# EasyEDA Pro project ProPrj_CSDR_2026-11-13.epro, board PCB1
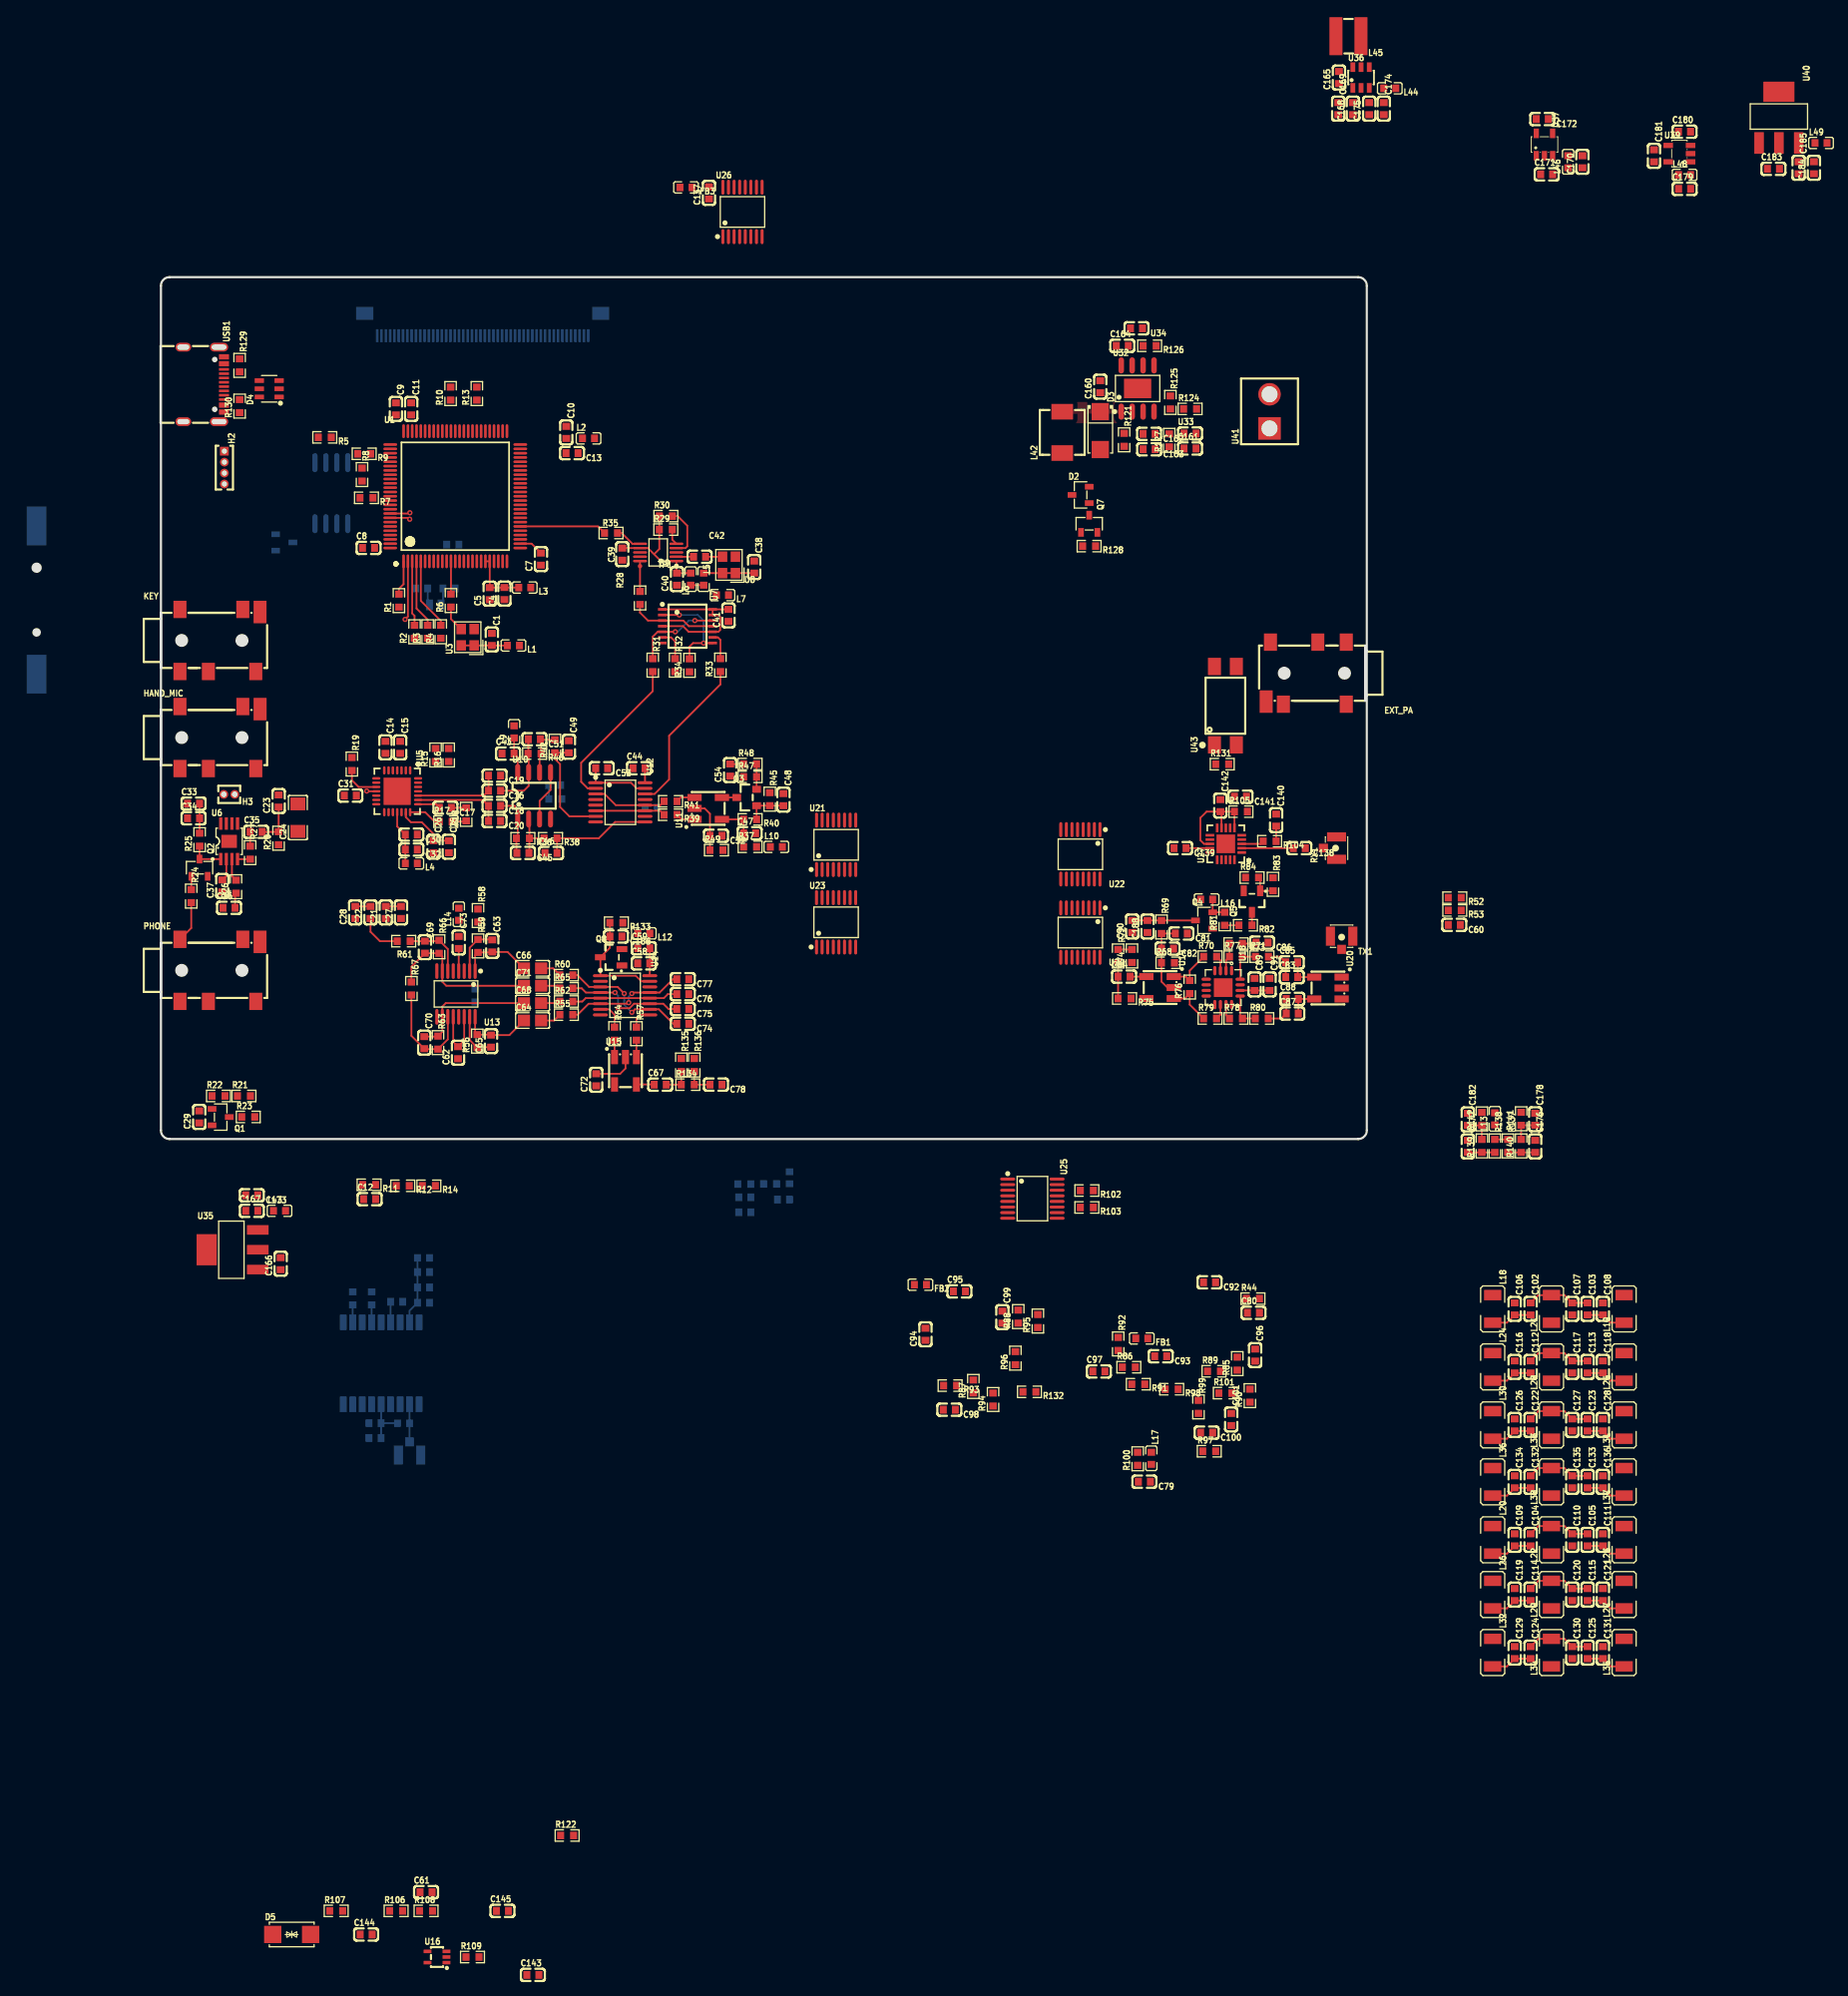
[diagram p16: board, top side]
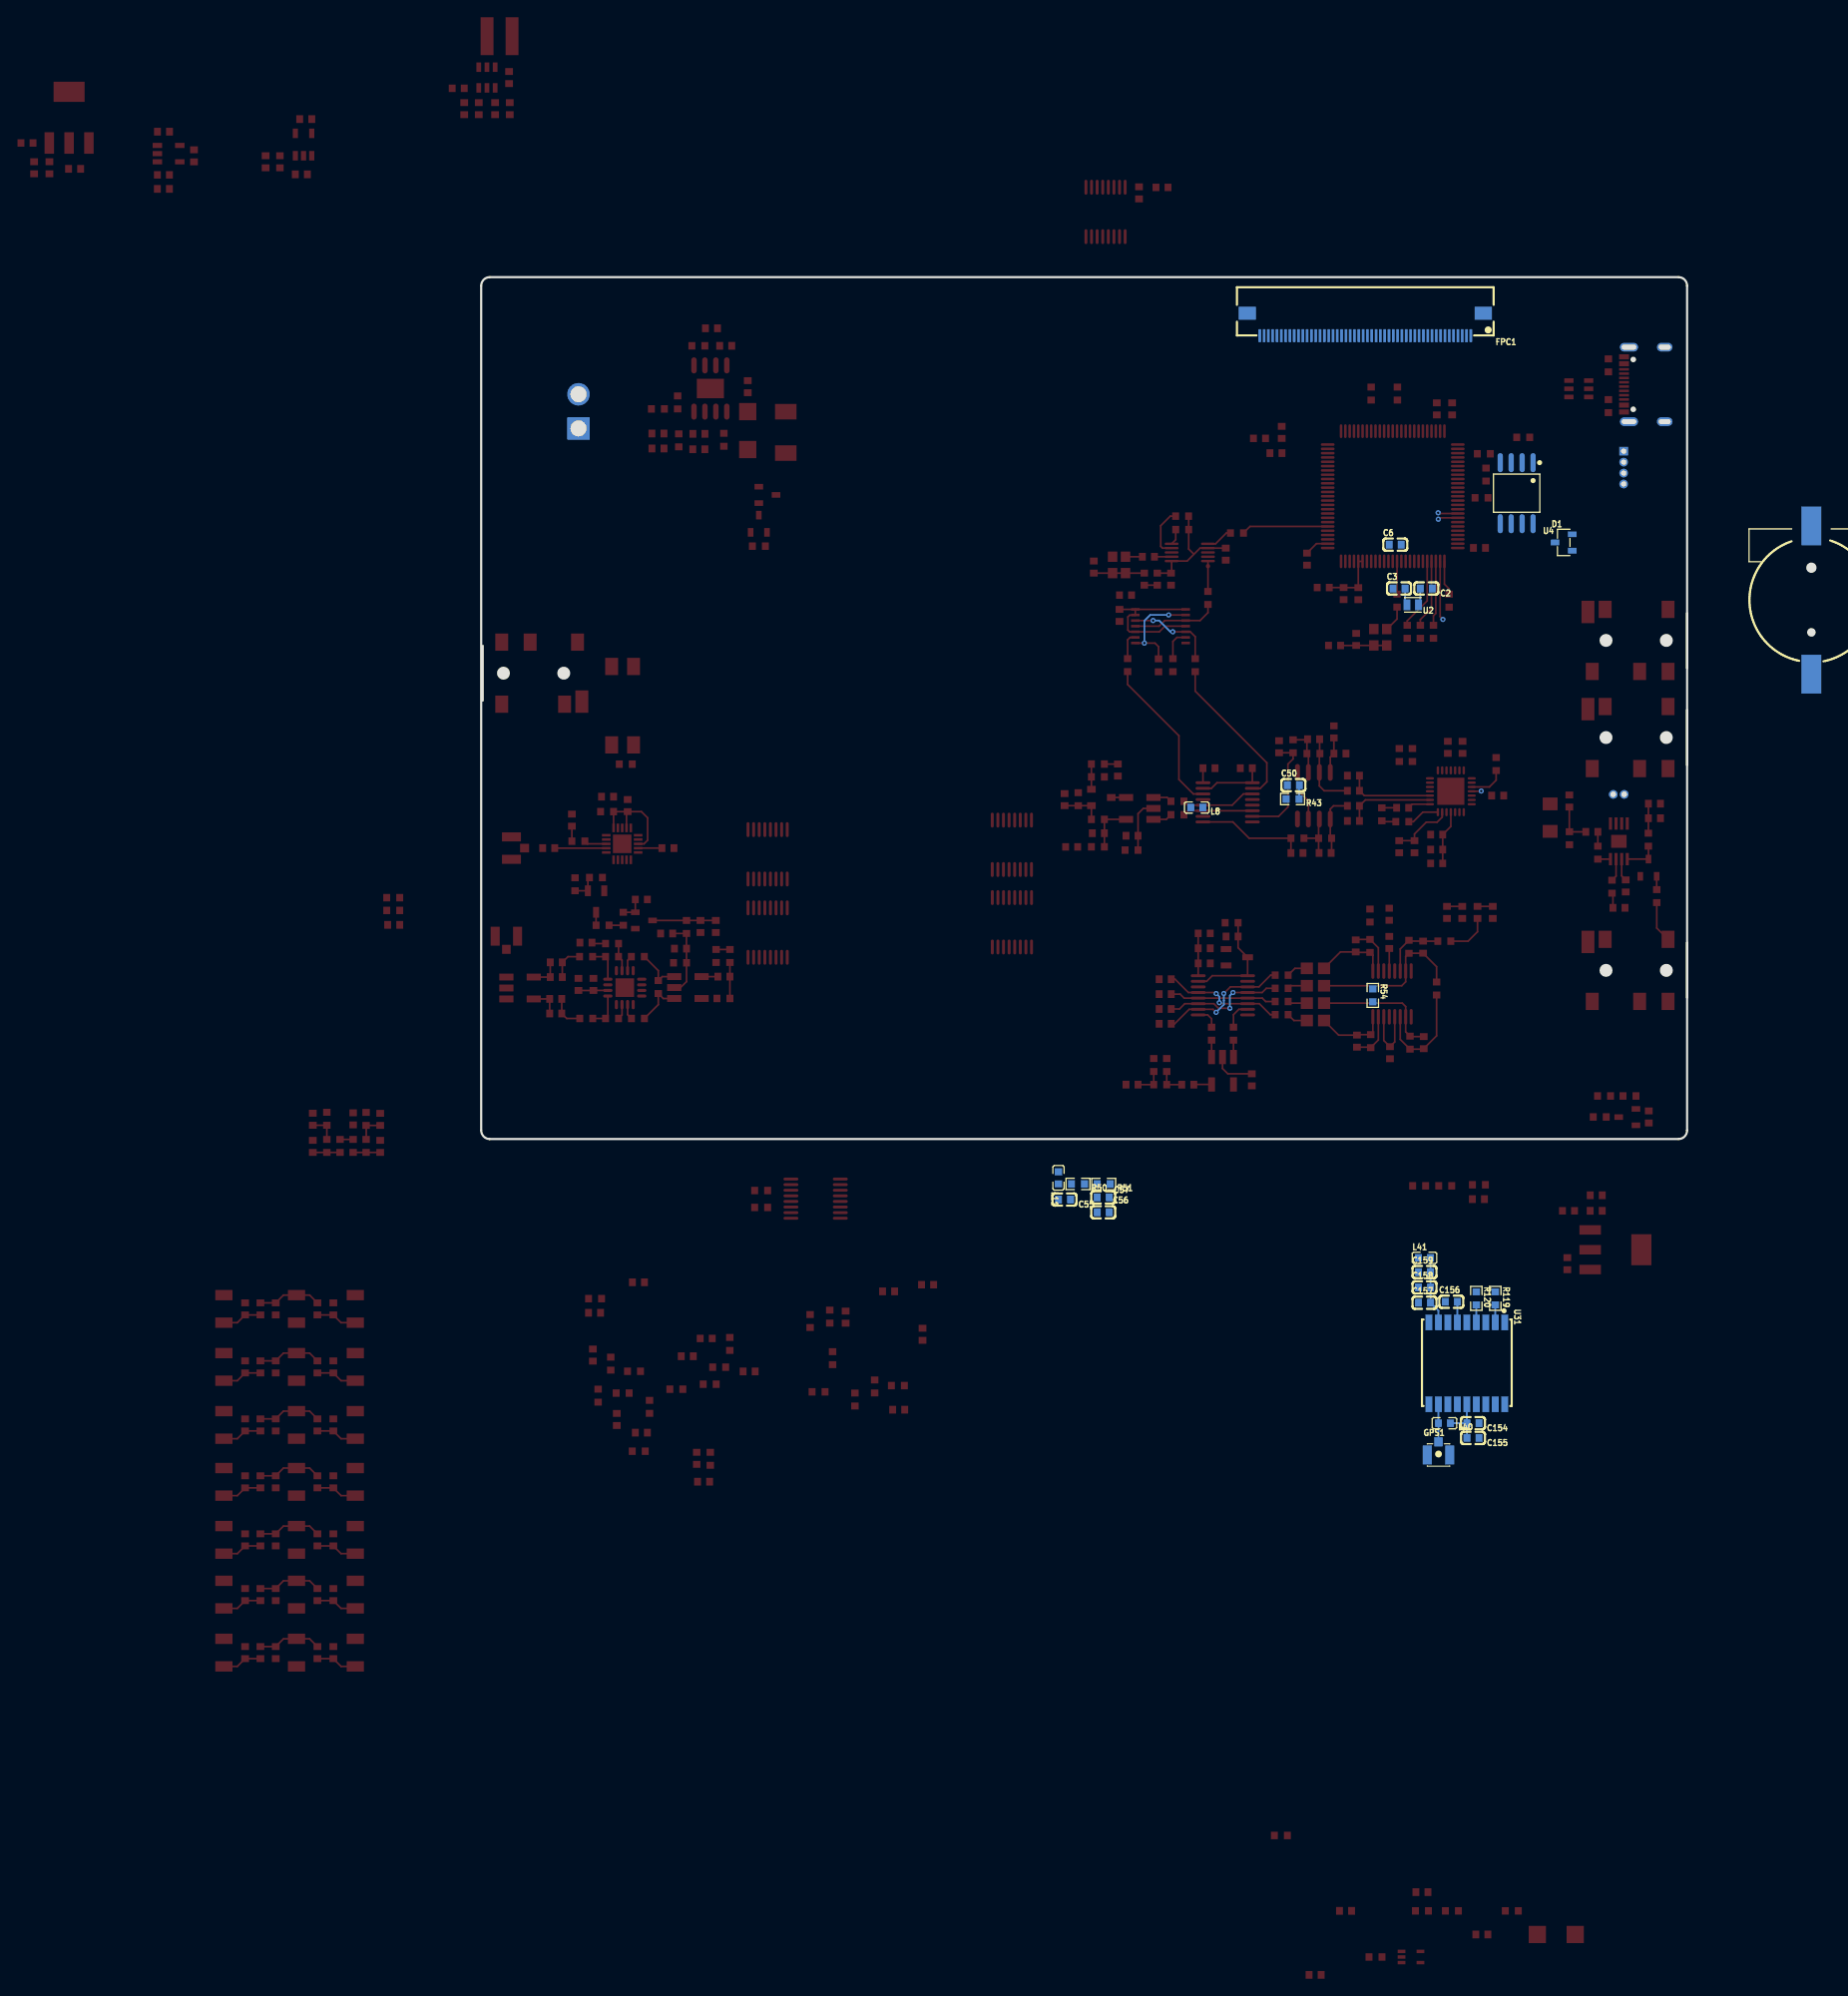
[diagram p17: board, bottom side, seen from below]

Outline 155.03 x 100 mm; copper layers: Top Layer, Inner1, Inner2, Bottom Layer. Coordinates in mm from the lower left corner of the outline.
Outline path: 15.03,99 15.03,1 arc(15.32,0.29) 16.03,0 154.03,0 arc(154.73,0.29) 155.03,1 155.03,99 arc(154.73,99.71) 154.03,100 16.03,100 arc(15.32,99.71) 15.03,99
Stack: Top Layer 0.035mm Outer layer thickness 1oz / Dielectric1 0.4133mm 7628 RC49% 8.6mil / Inner1 0.035mm Inner layer thickness / Dielectric2 0.4133mm 1.1mm H/HOZ Copper / Inner2 0.035mm Inner layer thickness / Dielectric3 0.4133mm 7628 RC49% 8.6mil / Bottom Layer 0.035mm Outer layer thickness 1oz

## Design rules (mm)
net USB_P: DP1
net USB_N: DP1
spacing copperThickness1oz (default): track to track 0.127, other pairs 0.127 to 0.5
spacing copperThickness2oz: track to track 0.2, other pairs 0.127 to 0.5
spacing copperThicknessInner0.5oz: track to track 0.127, other pairs 0.127 to 0.5
spacing Analog_Sense: track to track 0.3, other pairs 0.127 to 0.5
spacing Power: track to track 0.6, other pairs 0.127 to 0.6
spacing Power_HC: track to track 0.6, other pairs 0.127 to 0.6
spacing RF_50ohm: track to track 0.5, other pairs 0.127 to 0.5
spacing USB_90ohm: track to track 0.45, other pairs 0.127 to 0.5
spacing LO_CLK: track to track 0.3, other pairs 0.127 to 0.5
track width copperThickness1oz (default): min 0.1, default 0.2, max 5
track width copperThickness2oz: min 0.203, default 0.254, max 2.54
track width copperThickness0.5oz: min 0.1, default 0.2, max 5
track width Analog_Sense: min 0.2, default 0.3, max 5
track width Power: min 0.3, default 0.35, max 5
track width Power_HC: min 0.8, default 2, max 5
track width RF_50ohm: min 0.2, default 0.38, max 5
track width USB_90ohm: min 0.3, default 0.3, max 5
track width VBUS: min 0.3, default 0.5, max 5
track width LO_CLK: min 0.15, default 0.2, max 0.5
differential pair differentialPair (default): width min 0.25, default 0.3, max 0.4; gap min 0.15, default 0.15
net GND uses copperRegion1
net MCU_VDD uses Power, copperRegion_Power
net RX_ANT uses RF_50ohm, copperRegion_RF_50ohm
net VIN uses Power, copperRegion_Power
net $14N11 uses copperRegion1
net 8V uses Power, copperRegion_Power
net 5VA uses Power, copperRegion_Power
net 3V3_LO uses Power, copperRegion_Power
net 3V3_CODEC uses Power, copperRegion_Power
net USB_P uses USB_90ohm, copperRegion_USB_90ohm
net USB_N uses USB_90ohm, copperRegion_USB_90ohm
net OUT_TX uses RF_50ohm, copperRegion_RF_50ohm
net R_CLK_S0 uses LO_CLK, copperRegion_LO_CLK
net T_CLK_S0 uses LO_CLK, copperRegion_LO_CLK
net T_CLK_S1 uses LO_CLK, copperRegion_LO_CLK
net R_CLK_S1 uses LO_CLK, copperRegion_LO_CLK

## Placement (name value [footprint] x y rotation side)
BT1  CR1220-A1  [BAT-SMD_CR1220-2]  0.59 62.54 270 bottom
C1  100nF  [C0603]  53.45 57.97 270 top
C2  15pF  [C0603]  45.3 63.88 0 bottom
C3  15pF  [C0603]  48.47 63.88 180 bottom
C4  100nF  [C0603]  54.9 63.29 90 top
C5  1uF  [C0603]  53.2 63.28 90 top
C6  100nF  [C0603]  48.91 68.97 180 bottom
C7  100nF  [C0603]  59.15 67.28 90 top
C8  100nF  [C0603]  39.13 68.58 0 top
C9  100nF  [C0603]  42.31 84.71 270 top
C10  10uF  [C0603]  62.09 81.99 270 top
C11  2.2uF  [C0603]  44.08 84.71 270 top
C12  100nF  [C0603]  39.25 -6.98 0 top
C13  2.2uF  [C0603]  62.76 79.58 180 top
C14  10uF  [C0603]  41.09 45.44 270 top
C15  100nF  [C0603]  42.8 45.44 270 top
C16  1uF  [C0603]  53.76 40.41 180 top
C17  1uF  [C0603]  48.05 38.43 180 top
C18  1uF  [C0603]  53.76 38.66 180 top
C19  1nF  [C0603]  53.76 42.16 180 top
C20  1nF  [C0603]  53.76 36.91 180 top
C21  1uF  [C0603]  41.13 26.29 90 top
C22  1uF  [C0603]  39.36 26.29 90 top
C23  1uF  [C0603]  28.7 39.22 90 top
C24  220uF  [C1206]  30.93 37.29 90 top
C25  100nF  [C0603]  48.45 33.92 270 top
C26  10uF  [C0603]  46.67 33.92 270 top
C27  1nF  [C0603]  42.9 26.29 90 top
C28  1nF  [C0603]  37.58 26.29 90 top
C29  1uF  [C0603]  19.47 2.56 90 top
C30  10uF  [C0603]  44.1 35.32 180 top
C31  100nF  [C0603]  37.01 39.85 0 top
C32  100nF  [C0603]  44.1 33.58 180 top
C33  100nF  [C0603]  18.82 38.91 0 top
C34  10uF  [C0603]  18.82 37.22 0 top
C35  1uF  [C0603]  26.08 35.64 0 top
C36  1uF  [C0603]  22.93 26.83 0 top
C37  1uF  [C0603]  22.15 29.36 90 top
C38  100nF  [C0603]  83.9 66.36 270 top
C39  100nF  [C0603]  68.59 67.86 90 top
C40  100nF  [C0603]  74.94 64.96 90 top
C41  100nF  [C0603]  80.92 60.75 90 top
C42  10nF  [C0603]  77.56 67.56 180 top
C43  100nF  [C0603]  55.33 44.72 0 top
C44  100nF  [C0603]  70.53 43.02 0 top
C45  390pF  [C0603]  57.05 33.19 180 top
C46  10nF  [C0603]  60.32 33.19 0 top
C47  100nF  [C0603]  83.37 35.48 0 top
C48  100nF  [C0603]  87.3 39.38 270 top
C49  10nF  [C0603]  62.39 45.52 270 top
C50  100nF  [C0603]  60.73 41.06 180 bottom
C51  390pF  [C0603]  58.39 46.39 180 top
C52  100nF  [C0603]  79.47 35.19 180 top
C53  100nF  [C0603]  66.2 43.02 180 top
C54  100nF  [C0603]  81.11 42.81 90 top
C55  100nF  [C0603]  87.31 -7.02 0 bottom
C56  100nF  [C0603]  82.81 -6.77 0 bottom
C57  10uF  [C0603]  82.81 -8.5 0 bottom
C58  100nF  [C0603]  71.08 20.38 0 top
C59  100nF  [C0603]  71.08 22.13 0 top
C60  100nF  [C0603]  165.18 24.85 180 top
C61  1nF  [C0603]  45.81 -87.38 0 top
C62  1uF  [C0603]  49.52 10.01 90 top
C63  100pF  [C0603]  53.49 22.4 270 top
C64  22uF/0R  [C0805]  58.17 13.75 0 top
C65  100pF  [C0603]  53.35 11.36 90 top
C66  22uF/0R  [C0805]  58.17 19.8 0 top
C67  100nF  [C0603]  72.99 6.31 0 top
C68  22uF/0R  [C0805]  58.17 15.77 0 top
C69  100pF  [C0603]  45.67 22.26 270 top
C70  100pF  [C0603]  45.6 11.18 270 top
C71  22uF/0R  [C0805]  58.17 17.78 0 top
C72  100nF  [C0603]  65.56 6.87 90 top
C73  100nF  [C0603]  49.6 22.81 270 top
C74  22nF  [C0603]  75.61 13.37 180 top
C75  22nF  [C0603]  75.61 15.09 180 top
C76  22nF  [C0603]  75.61 16.81 180 top
C77  22nF  [C0603]  75.61 18.54 180 top
C78  100nF  [C0603]  79.47 6.31 180 top
C79  100nF  [C0603]  129.21 -39.76 180 top
C80  100nF  [C0603]  141.86 -20.16 0 top
C81  100nF  [C0603]  133.49 23.85 180 top
C82  470pF  [C0603]  131.89 22.09 180 top
C83  1uF  [C0603]  146.31 18.79 0 top
C84  100nF  [C0603]  126.85 18.84 0 top
C85  680pF  [C0603]  146.31 20.5 0 top
C86  100nF  [C0603]  142.86 22.79 180 top
C87  680pF  [C0603]  146.37 14.56 0 top
C88  1uF  [C0603]  146.37 16.26 0 top
C89  100nF  [C0603]  142 17.94 270 top
C90  470pF  [C0603]  127.79 24.66 90 top
C91  1uF  [C0603]  143.74 17.94 270 top
C92  100nF  [C0603]  136.77 -16.62 180 top
C93  100nF  [C0603]  131.1 -25.2 180 top
C94  100nF  [C0603]  103.78 -22.66 90 top
C95  100nF  [C0603]  107.73 -17.68 0 top
C96  100nF  [C0603]  142.06 -25.07 270 top
C97  100nF  [C0603]  123.92 -26.97 0 top
C98  100nF  [C0603]  106.56 -31.41 180 top
C99  100nF  [C0603]  112.72 -20.67 270 top
C100  100nF  [C0603]  136.43 -34.07 180 top
C101  1uF  [C0603]  139.28 -32.54 270 top
C102  390pF  [C0603]  174.04 -19.71 270 top
C103  390pF  [C0603]  180.65 -19.71 270 top
C104  390pF  [C0603]  174.04 -46.51 270 top
C105  390pF  [C0603]  180.65 -46.51 270 top
C106  390pF  [C0603]  172.19 -19.71 270 top
C107  390pF  [C0603]  178.88 -19.71 270 top
C108  390pF  [C0603]  182.43 -19.71 270 top
C109  390pF  [C0603]  172.19 -46.51 270 top
C110  390pF  [C0603]  178.88 -46.51 270 top
C111  390pF  [C0603]  182.43 -46.51 270 top
C112  390pF  [C0603]  174.04 -26.44 270 top
C113  390pF  [C0603]  180.65 -26.44 270 top
C114  390pF  [C0603]  174.04 -52.86 270 top
C115  390pF  [C0603]  180.65 -52.86 270 top
C116  390pF  [C0603]  172.19 -26.44 270 top
C117  390pF  [C0603]  178.88 -26.44 270 top
C118  390pF  [C0603]  182.43 -26.44 270 top
C119  390pF  [C0603]  172.19 -52.86 270 top
C120  390pF  [C0603]  178.88 -52.86 270 top
C121  390pF  [C0603]  182.43 -52.86 270 top
C122  390pF  [C0603]  174.04 -33.17 270 top
C123  390pF  [C0603]  180.65 -33.17 270 top
C124  390pF  [C0603]  174.04 -59.59 270 top
C125  390pF  [C0603]  180.65 -59.59 270 top
C126  390pF  [C0603]  172.19 -33.17 270 top
C127  390pF  [C0603]  178.88 -33.17 270 top
C128  390pF  [C0603]  182.43 -33.17 270 top
C129  390pF  [C0603]  172.19 -59.59 270 top
C130  390pF  [C0603]  178.88 -59.59 270 top
C131  390pF  [C0603]  182.43 -59.59 270 top
C132  390pF  [C0603]  174.04 -39.78 270 top
C133  390pF  [C0603]  180.65 -39.78 270 top
C134  390pF  [C0603]  172.19 -39.78 270 top
C135  390pF  [C0603]  178.88 -39.78 270 top
C136  390pF  [C0603]  182.43 -39.78 270 top
C137  100nF  [C0603]  78.65 109.78 90 top
C138  100nF  [C0603]  147.19 33.75 180 top
C139  100nF  [C0603]  133.34 33.75 180 top
C140  100pF  [C0603]  144.5 37 270 top
C141  100nF  [C0603]  140.36 39.72 180 top
C142  10uF  [C0603]  138.02 38.69 270 top
C143  10nF  [C0603]  58.21 -96.98 0 top
C144  4.7nF  [C0603]  38.85 -92.3 0 top
C145  100nF  [C0603]  54.68 -89.56 0 top
C154  10nF  [C0603]  39.88 -32.97 0 bottom
C155  47pF  [C0603]  39.88 -34.69 0 bottom
C156  100nF  [C0603]  42.4 -18.88 180 bottom
C157  820pF  [C0603]  45.51 -19 180 bottom
C158  100nF  [C0603]  45.51 -17.22 180 bottom
C159  10uF  [C0603]  45.51 -15.44 180 bottom
C160  100nF  [C0603]  124.08 87.29 90 top
C161  100nF  [C0603]  134.5 80.12 0 top
C162  5.6nF  [C0603]  129.75 81.82 180 top
C163  100nF  [C0603]  129.76 80.03 180 top
C164  100nF  [C0603]  126.64 92.03 0 top
C165  100nF  [C0603]  151.79 123.16 90 top
C166  47uF  [C0603]  28.93 -14.46 90 top
C167  100nF  [C0603]  25.58 -8.33 0 top
C168  100nF  [C0603]  153.41 119.55 90 top
C169  22uF  [C0603]  151.71 119.55 270 top
C170  22uF  [C0603]  180.05 113.39 90 top
C171  1uF  [C0603]  175.9 111.93 0 top
C172  1uF  [C0603]  175.39 118.34 180 top
C173  10uF  [C0603]  25.57 -6.53 180 top
C174  22uF  [C0603]  156.99 119.55 270 top
C175  100nF  [C0603]  155.31 119.55 90 top
C176  1uF  [C0603]  174.57 -0.85 270 top
C177  1uF  [C0603]  166.75 -0.85 270 top
C178  1uF  [C0603]  174.57 2.3 270 top
C179  22uF  [C0603]  191.92 110.24 0 top
C180  1uF  [C0603]  191.91 116.88 0 top
C181  1uF  [C0603]  188.37 114.08 270 top
C182  1uF  [C0603]  166.75 2.28 270 top
C183  47uF  [C0603]  202.23 112.57 0 top
C184  100nF  [C0603]  206.93 112.69 90 top
C185  10uF  [C0603]  205.15 112.69 270 top
C186  100nF  [C0603]  67.85 23.5 180 top
C188  10uF  [C0603]  129.57 24.66 90 top
D1  BAT54C  [SOT-23-3_L2.9-W1.3-P1.90-LS2.4-BR]  29.35 69.22 180 bottom
D2  BAT54C  [SOT-23-3_L2.9-W1.3-P1.90-LS2.4-BR]  121.79 74.73 0 top
D3  SS34  [SMA_L4.3-W2.6-LS5.1-RD]  124.08 82.2 270 top
D4  USBLC6-2SC6  [SOT-23-6_L2.9-W1.6-P0.95-LS2.8-BL]  27.6 87.05 90 top
D5  SMAJ15CA  [SMA_L4.3-W2.6-LS5.1-BI]  30.21 -92.3 0 top
EXT_PA  PJ-342  [AUDIO-SMD_PJ-342_C668606]  147.99 54.05 180 top
FB1  CBM160808U471T  [L0603]  128.9 -23.14 180 top
FB2  CBM160808U471T  [L0603]  103.2 -16.91 180 top
FB3  CBM160808U471T  [L0603]  75.99 110.41 180 top
FPC1  FPC0521-50PH20  [FPC-SMD_FPC0521-50PH20]  52.39 94.51 0 bottom
GPS1  6GHz  [IPEX-SMD_3P-L2.6-W2.6-LS3.0_RF1200001R]  43.89 -35.9 180 bottom
H2  PZ127V-11-04-0720  [HDR-TH_4P-P1.27-V-M]  22.39 77.9 270 top
H3  ZX-PZ1.27-1-2PZZ  [HDR-TH_2P-P1.27-V-M-2]  22.96 39.99 180 top
HAND_MIC  PJ-342  [AUDIO-SMD_PJ-342_C668606]  21.89 46.58 0 top
KEY  PJ-342  [AUDIO-SMD_PJ-342_C668606]  21.89 57.85 0 top
L1  MGGB1608M501HT-LF  [L0603]  55.95 57.26 180 top
L2  MGGB1608M501HT-LF  [L0603]  64.67 81.29 0 top
L3  MGGB1608M501HT-LF  [L0603]  57.27 63.99 180 top
L4  PBY160808T-601Y-N  [L0603]  44.1 31.98 180 top
L5  PBY160808T-601Y-N  [L0603]  78.04 64.96 270 top
L6  PBY160808T-601Y-N  [L0603]  76.54 64.96 270 top
L7  PBY160808T-601Y-N  [L0603]  80.22 63.11 180 top
L8  MGGB1608M501HT-LF  [L0603]  71.95 38.46 0 bottom
L9  MGGB1608M501HT-LF  [L0603]  56.03 47.24 90 top
L10  MGGB1608M501HT-LF  [L0603]  86.47 33.89 0 top
L11  MGGB1608M501HT-LF  [L0603]  88 -4.5 90 bottom
L12  PBY160808T-501Y-N  [L0603]  71.08 23.86 180 top
L13  PBY160808T-501Y-N  [L0603]  169.89 2.34 90 top
L14  PBY160808T-501Y-N  [L0603]  49.61 26.08 90 top
L16  MGGB1608M501HT-LF  [L0603]  136.43 27.8 180 top
L17  MGGB1608M501HT-LF  [L0603]  130.01 -37.05 270 top
L18  12nH  [L1210]  169.64 -19.71 270 top
L19  12nH  [L1210]  184.9 -19.71 90 top
L20  12nH  [L1210]  169.64 -46.51 270 top
L21  12nH  [L1210]  176.46 -19.71 90 top
L22  12nH  [L1210]  176.46 -46.51 90 top
L23  12nH  [L1210]  184.9 -46.51 90 top
L24  12nH  [L1210]  169.64 -26.44 270 top
L25  12nH  [L1210]  184.9 -26.44 90 top
L26  12nH  [L1210]  169.64 -52.86 270 top
L27  12nH  [L1210]  184.9 -52.86 90 top
L28  12nH  [L1210]  176.46 -26.44 90 top
L29  12nH  [L1210]  176.46 -52.86 90 top
L30  12nH  [L1210]  169.64 -33.17 270 top
L31  12nH  [L1210]  184.9 -33.17 90 top
L32  12nH  [L1210]  169.64 -59.59 270 top
L33  12nH  [L1210]  176.46 -33.17 90 top
L34  12nH  [L1210]  176.46 -59.59 90 top
L35  12nH  [L1210]  184.9 -59.59 90 top
L36  12nH  [L1210]  169.64 -39.78 270 top
L37  12nH  [L1210]  184.9 -39.78 90 top
L38  12nH  [L1210]  176.46 -39.78 90 top
L40  27nH  [L0603]  43.2 -32.97 0 bottom
L41  MGGB1608M501HT-LF  [L0603]  45.51 -13.79 180 bottom
L42  4.7uH  [IND-SMD_L5.2-W5.2_YSPI0530]  119.67 81.99 90 top
L43  MGGB1608M501HT-LF  [L0603]  28.79 -8.33 0 top
L44  MGGB1608M501HT-LF  [L0603]  157.69 121.91 180 top
L45  10uH  [IND-SMD_L4.0-W4.0_SNR4030]  152.89 127.96 180 top
L46  MGGB1608M501HT-LF  [L0603]  178.39 113.39 90 top
L48  MGGB1608M501HT-LF  [L0603]  191.92 111.87 0 top
L49  MGGB1608M501HT-LF  [L0603]  207.76 115.57 0 top
PHONE  PJ-342  [AUDIO-SMD_PJ-342_C668606]  21.89 19.57 0 top
Q1  MMBT3904  [SOT-23-3_L2.9-W1.3-P1.90-LS2.4-BR]  21.96 2.54 180 top
Q2  S8050  [SOT-23-3_L2.9-W1.3-P1.90-LS2.4-BR]  19.51 31.48 270 top
Q3  BFR92PE6327  [SOT-23_L2.9-W1.3-P1.90-LS2.4-BR]  83.03 39.63 0 top
Q4  IRLML6402  [SOT-23-3_L2.9-W1.3-P1.90-LS2.4-BR]  136.13 25.36 0 top
Q5  2N7002  [SOT-23-3_L2.9-W1.5-P1.90-LS2.6-BR]  141.69 27.55 90 top
Q7  BSS123  [SOT-23-3_L2.9-W1.3-P1.90-LS2.4-BR]  122.79 71.39 270 top
Q8  2N7002  [SOT-23-3_L2.9-W1.5-P1.90-LS2.6-BR]  67.29 21.09 0 top
R1  22Ω  [R0603]  42.65 62.47 90 top
R2  22Ω  [R0603]  44.47 58.85 90 top
R3  22Ω  [R0603]  45.99 58.85 90 top
R4  22Ω  [R0603]  47.52 58.85 90 top
R5  10kΩ  [R0603]  34.05 81.41 180 top
R6  22Ω  [R0603]  48.7 62.47 90 top
R7  22Ω  [R0603]  38.89 74.4 180 top
R8  22Ω  [R0603]  38.37 77.09 270 top
R9  22Ω  [R0603]  38.62 79.51 180 top
R10  22Ω  [R0603]  48.66 86.49 90 top
R11  47kΩ  [R0603]  39.19 -5.31 180 top
R12  DNP  [R0603]  43.11 -5.43 180 top
R13  22Ω  [R0603]  51.7 86.49 90 top
R14  10kΩ  [R0603]  46.13 -5.43 180 top
R15  10kΩ  [R0603]  46.91 44.56 90 top
R16  10kΩ  [R0603]  48.44 44.56 90 top
R17  1kΩ  [R0603]  48.09 36.82 0 top
R18  2.2kΩ  [R0603]  50.47 37.67 90 top
R19  22Ω  [R0603]  37.19 43.51 270 top
R20  47kΩ  [R0603]  28.68 34.9 90 top
R21  470kΩ  [R0603]  24.67 5 0 top
R22  100kΩ  [R0603]  21.71 5 0 top
R23  100kΩ  [R0603]  25.17 2.56 0 top
R24  10kΩ  [R0603]  18.55 28.18 270 top
R25  100kΩ  [R0603]  19.52 34.73 90 top
R26  20kΩ  [R0603]  23.74 29.28 90 top
R27  20kΩ  [R0603]  25.38 33.22 270 top
R28  22Ω  [R0603]  70.65 62.78 270 top
R29  10kΩ  [R0603]  73.64 70.71 0 top
R30  10kΩ  [R0603]  73.65 72.27 0 top
R31  0Ω  [R0603]  72.13 54.98 270 top
R32  0Ω  [R0603]  74.72 54.98 270 top
R33  0Ω  [R0603]  79.98 54.99 90 top
R34  0Ω  [R0603]  76.39 54.96 90 top
R35  22Ω  [R0603]  67.28 70.31 0 top
R36  2.2kΩ  [R0603]  57.05 34.89 180 top
R37  100Ω  [R0603]  83.43 33.9 0 top
R38  47Ω  [R0603]  60.26 34.9 180 top
R39  10Ω  [R0603]  74.19 37.62 180 top
R40  4.7kΩ  [R0603]  83.43 37.09 180 top
R41  10Ω  [R0603]  74.19 39.19 180 top
R42  47Ω  [R0603]  60.77 45.57 90 top
R43  100Ω  [R0603]  60.82 39.45 0 bottom
R44  56Ω  [R0603]  141.8 -18.52 0 top
R45  1.5kΩ  [R0603]  85.71 39.43 270 top
R46  2.2kΩ  [R0603]  58.41 44.72 180 top
R47  10Ω  [R0603]  83.43 42.02 0 top
R48  20Ω  [R0603]  83.43 43.51 0 top
R49  100Ω  [R0603]  79.52 33.52 0 top
R50  1.5kΩ  [R0603]  85.74 -5.21 0 bottom
R51  1.5kΩ  [R0603]  82.75 -5.22 0 bottom
R52  10kΩ  [R0603]  165.24 28 180 top
R53  10kΩ  [R0603]  165.24 26.52 180 top
R54  10kΩ  [R0603]  51.51 16.66 270 bottom
R55  47Ω  [R0603]  62.09 14.43 0 top
R56  10kΩ  [R0603]  51.76 11.36 90 top
R57  47Ω  [R0603]  70.23 12.22 270 top
R58  10kΩ  [R0603]  51.84 25.93 270 top
R59  10kΩ  [R0603]  51.84 22.4 270 top
R60  47Ω  [R0603]  62.09 19.01 0 top
R61  10kΩ  [R0603]  43.21 22.96 0 top
R62  47Ω  [R0603]  62.09 15.96 0 top
R63  10kΩ  [R0603]  47.2 11.18 270 top
R64  47Ω  [R0603]  67.69 12.22 270 top
R65  47Ω  [R0603]  62.09 17.49 0 top
R66  10kΩ  [R0603]  47.32 22.3 270 top
R67  10kΩ  [R0603]  44.11 17.46 270 top
R68  1kΩ  [R0603]  131.94 20.45 0 top
R69  1kΩ  [R0603]  131.19 24.6 270 top
R70  22Ω  [R0603]  136.84 21.16 0 top
R71  5.6Ω  [R0603]  142.85 21.16 0 top
R72  18Ω  [R0603]  126.15 21.24 270 top
R73  100Ω  [R0603]  139.83 22.68 180 top
R74  300Ω  [R0603]  127.76 21.24 90 top
R75  300Ω  [R0603]  126.9 16.31 180 top
R76  220Ω  [R0603]  134.46 17.63 90 top
R77  470Ω  [R0603]  139.83 21.16 0 top
R78  470Ω  [R0603]  139.83 13.99 0 top
R79  22Ω  [R0603]  136.83 13.99 0 top
R80  5.6Ω  [R0603]  142.83 13.99 0 top
R81  10kΩ  [R0603]  138.53 25.56 90 top
R82  1kΩ  [R0603]  140.93 24.8 180 top
R83  1kΩ  [R0603]  144.13 29.56 270 top
R84  10kΩ  [R0603]  141.7 30.34 0 top
R85  4.7kΩ  [R0603]  139.98 -26.06 90 top
R86  4.7kΩ  [R0603]  127.4 -26.48 0 top
R87  4.7kΩ  [R0603]  109.34 -28.71 90 top
R88  4.7kΩ  [R0603]  114.56 -20.61 90 top
R89  100kΩ  [R0603]  137.29 -26.95 0 top
R90  4.7kΩ  [R0603]  141.45 -29.78 90 top
R91  4.7kΩ  [R0603]  128.5 -28.45 180 top
R92  100kΩ  [R0603]  126.16 -23.78 270 top
R93  100kΩ  [R0603]  106.65 -28.61 180 top
R94  4.7kΩ  [R0603]  111.64 -30.23 90 top
R95  4.7kΩ  [R0603]  116.84 -21.12 90 top
R96  100kΩ  [R0603]  114.23 -25.43 90 top
R97  10kΩ  [R0603]  136.73 -36.22 0 top
R98  100kΩ  [R0603]  132.37 -29.03 180 top
R99  100kΩ  [R0603]  135.48 -31.08 270 top
R100  100kΩ  [R0603]  128.43 -37.1 90 top
R101  100kΩ  [R0603]  138.6 -29.48 0 top
R102  100Ω  [R0603]  122.52 -5.98 180 top
R103  100Ω  [R0603]  122.52 -7.94 180 top
R104  1kΩ  [R0603]  143.74 34.56 180 top
R105  100Ω  [R0603]  140.41 37.99 0 top
R106  100kΩ  [R0603]  42.33 -89.56 0 top
R107  100kΩ  [R0603]  35.37 -89.56 0 top
R108  150kΩ  [R0603]  45.81 -89.56 0 top
R109  100Ω  [R0603]  51.2 -94.91 0 top
R119  33Ω  [R0603]  37.29 -18.49 270 bottom
R120  33Ω  [R0603]  39.49 -18.49 270 bottom
R121  100kΩ  [R0603]  126.85 81.13 270 top
R122  10kΩ  [R0603]  62.18 -80.81 0 top
R124  75kΩ  [R0603]  134.51 84.71 0 top
R125  8.2kΩ  [R0603]  132.22 85.47 270 top
R126  64kΩ  [R0603]  129.81 92.03 180 top
R127  6.8kΩ  [R0603]  132.09 81.06 90 top
R128  30kΩ  [R0603]  122.79 68.79 180 top
R129  5.1kΩ  [R0603]  24.16 89.76 270 top
R130  5.1kΩ  [R0603]  24.16 85.04 90 top
R131  330Ω  [R0603]  138.24 43.49 0 top
R132  100kΩ  [R0603]  115.86 -29.33 180 top
R133  10kΩ  [R0603]  67.9 25.09 180 top
R134  18Ω  [R0603]  76.19 6.31 0 top
R135  300Ω  [R0603]  75.44 8.59 270 top
R136  300Ω  [R0603]  76.94 8.59 270 top
R137  10kΩ  [R0603]  171.41 -0.8 270 top
R138  10kΩ  [R0603]  169.89 -0.8 270 top
R139  100kΩ  [R0603]  168.39 -0.8 90 top
R140  100kΩ  [R0603]  172.94 -0.8 90 top
R141  10kΩ  [R0603]  172.94 2.35 90 top
R142  10kΩ  [R0603]  168.39 2.33 90 top
RX1  6GHz  [IPEX-SMD_3P-L2.6-W2.6-LS3.0_RF1200001R]  150.75 33.75 90 top
TP1  -  [Test-Point-0.5mm]  70.65 66.47 0 top
TX1  6GHz  [IPEX-SMD_3P-L2.6-W2.6-LS3.0_RF1200001R]  152.1 22.77 180 top
U1  STM32H743VIT6  [LQFP-100_L14.0-W14.0-P0.50-LS16.0-BL]  49.2 74.58 0 top
U2  32.768kHz  [CRYSTAL-SMD_L2.1-W1.2_FC2012AN]  46.88 61.98 0 bottom
U3  24MHz  [OSC-SMD_4P-L2.5-W2.0-BL-3]  50.64 58.22 90 top
U4  W25Q128DR-TD  [SOP-8_L5.3-W5.3-P1.27-LS7.9-BL]  34.81 74.94 0 bottom
U5  WM8731CLSEFL/R  [QFN-28_L5.0-W5.0-P0.50-TL-EP3.2]  42.46 40.35 270 top
U6  TPA6211TDGNRQ1  [HVSSOP-8_L3.0-W3.0-P0.65-LS4.9-BL-EP]  22.95 34.54 0 top
U7  SN74LVC74APWR  [TSSOP-14_L5.0-W4.4-P0.65-LS6.5-BL]  76.16 59.5 270 top
U8  25MHz  [OSC-SMD_4P-L2.5-W2.0-BL]  80.97 66.61 90 top
U9  MS5351M  [MSOP-10_L3.0-W3.0-P0.50-LS5.0-BL]  72.76 68.06 90 top
U10  LM4562MAX/NOPB  [SOIC-8_L5.0-W4.0-P1.27-LS6.0-BL]  58.35 39.83 0 top
U11  TC4-1T+  [XFMR-SMD_TC1-1TX]  78.57 38.36 90 top
U12  FST3253MTCX  [TSSOP-16_L5.0-W4.4-P0.65-LS6.4-BL]  68.36 39.06 270 top
U13  OPA4350EA/2K5  [SSOP-16_L4.9-W3.9-P0.64-LS6.0-BL]  49.28 16.83 180 top
U14  FST3253MTCX  [TSSOP-16_L5.0-W4.4-P0.65-LS6.4-BL]  68.91 16.67 270 top
U15  TC4-1T+  [XFMR-SMD_TC1-1TX]  68.96 7.92 0 top
U16  MCP6001T-I/LT  [SC-70-5_L2.1-W1.3-P0.65-LS2.1-BR]  47.08 -94.91 0 top
U18  OPA2675RGVR  [QFN-16_L4.0-W4.0-P0.65-TL-EP2.2]  138.35 17.56 270 top
U19  TC4-1T+  [XFMR-SMD_TC1-1TX]  131.02 17.57 270 top
U20  TC4-1T+  [XFMR-SMD_TC1-1TX]  150.51 17.52 270 top
U21  FST3253MTCX  [TSSOP-16_L5.0-W4.4-P0.65-LS6.4-BL]  93.42 34.14 0 top
U22  FST3253MTCX  [TSSOP-16_L5.0-W4.4-P0.65-LS6.4-BL]  121.77 33.03 180 top
U23  FST3253MTCX  [TSSOP-16_L5.0-W4.4-P0.65-LS6.4-BL]  93.41 25.15 0 top
U24  FST3253MTCX  [TSSOP-16_L5.0-W4.4-P0.65-LS6.4-BL]  121.77 23.95 180 top
U25  U74AHC595G  [TSSOP-16_L5.0-W4.4-P0.65-LS6.4-BL]  116.2 -6.92 270 top
U26  CD74HC238PW  [TSSOP-16_L5.0-W4.4-P0.65-LS6.4-BL]  82.54 107.57 0 top
U27  PE4312C-Z  [QFN-20_L4.0-W4.0-P0.50-BL-EP2.2]  138.65 34.25 90 top
U31  GP-02  [GPS-SMD_GP-02]  40.6 -26.02 270 bottom
U32  MP1584EN-LF-Z-JSM  [ESOP-8_L4.9-W3.9-P1.27-LS6.0-BL-EP-2]  128.42 87.08 0 top
U33  22uF  [C0603]  134.51 81.86 0 top
U34  22uF  [C0603]  128.29 94.06 180 top
U35  LDL1117S50R  [SOT-223-3_L6.5-W3.4-P2.30-LS7.0-BR]  23.31 -12.85 0 top
U36  AP63203WU-7  [TSOT-26_L2.9-W1.6-P0.95-LS2.8-BL]  154.36 123.16 0 top
U37  LP5907MFX-3.3  [SOT-23-5_L3.0-W1.7-P0.95-LS2.8-BR]  175.65 115.39 270 top
U39  LP5907MFX-3.3  [SOT-23-5_L3.0-W1.7-P0.95-LS2.8-BR]  191.32 114.33 0 top
U40  LDL1117S50R  [SOT-223-3_L6.5-W3.4-P2.30-LS7.0-BR]  202.87 118.54 270 top
U41  PZ396V-11-02P  [HDR-TH_2P-P3.96-V-M]  143.73 84.43 90 top
U43  PC817B  [SMD-4_L6.5-W4.6-P2.54-LS10.3-TL]  138.61 50.28 90 top
USB1  TYPE-C16PIN  [USB-C-SMD_TYPE-C16PIN]  19.99 87.56 270 top

## Footprints (pads in the part's own frame, mm; a bottom-side part is the same pattern mirrored in y, then rotated)
AUDIO-SMD_PJ-342_C668606
  rect 1.5x2 smd: 2(-4.65,3.6) 3(2.65,3.6) 5(-4.65,-3.6) 6(-1.35,-3.6) 7(4.15,-3.6)
  rect 1.5x2.6 smd: 4(4.65,3.3)
BAT-SMD_CR1220-2
  rect 4.5x2.3 smd: 1(-8.6,0) 2(8.6,0)
C0603
  rect 0.8x0.9 smd: 1(-0.7,0) 2(0.7,0)
C0805
  rect 1.41x1.35 smd: 1(-1,0) 2(1,0)
C1206
  rect 1.485x1.728 smd: 1(-1.593,0) 2(1.593,0)
CRYSTAL-SMD_L2.1-W1.2_FC2012AN
  rect 0.8x1.25 smd: 1(0.675,0) 2(-0.675,0)
ESOP-8_L4.9-W3.9-P1.27-LS6.0-BL-EP-2
  oval 0.63x1.865 smd: 1(-1.905,-2.683) 2(-0.635,-2.683) 3(0.635,-2.683) 4(1.905,-2.683) 5(1.905,2.683) 6(0.635,2.683) 7(-0.635,2.683) 8(-1.905,2.683)
  rect 3.15x2.26 smd: 9(0,0)
FPC-SMD_FPC0521-50PH20
  rect 0.3x1.5 smd: 1(-12.25,1.3) 2(-11.75,1.3) 3(-11.25,1.3) 4(-10.75,1.3) 5(-10.25,1.3) 6(-9.75,1.3) 7(-9.25,1.3) 8(-8.75,1.3) 9(-8.25,1.3) 10(-7.75,1.3) 11(-7.25,1.3) 12(-6.75,1.3) 13(-6.25,1.3) 14(-5.75,1.3) 15(-5.25,1.3) 16(-4.75,1.3) 17(-4.25,1.3) 18(-3.75,1.3) 19(-3.25,1.3) 20(-2.75,1.3) 21(-2.25,1.3) 22(-1.75,1.3) 23(-1.25,1.3) 24(-0.75,1.3) 25(-0.25,1.3) 26(0.25,1.3) 27(0.75,1.3) 28(1.25,1.3) 29(1.75,1.3) 30(2.25,1.3) 31(2.75,1.3) 32(3.25,1.3) 33(3.75,1.3) 34(4.25,1.3) 35(4.75,1.3) 36(5.25,1.3) 37(5.75,1.3) 38(6.25,1.3) 39(6.75,1.3) 40(7.25,1.3) 41(7.75,1.3) 42(8.25,1.3) 43(8.75,1.3) 44(9.25,1.3) 45(9.75,1.3) 46(10.25,1.3) 47(10.75,1.3) 48(11.25,1.3) 49(11.75,1.3) 50(12.25,1.3)
  rect 2x1.5 smd: 51(13.7,-1.3) 52(-13.7,-1.3)
GPS-SMD_GP-02
  rect 1.8x0.8 smd: 1(-4.75,4.4) 2(-4.75,3.3) 3(-4.75,2.2) 4(-4.75,1.1) 5(-4.75,0) 6(-4.75,-1.1) 7(-4.75,-2.2) 8(-4.75,-3.3) 9(-4.75,-4.4) 10(4.75,-4.4) 11(4.75,-3.3) 12(4.75,-2.2) 13(4.75,-1.1) 14(4.75,0) 15(4.75,1.1) 16(4.75,2.2) 17(4.75,3.3) 18(4.75,4.4)
HDR-TH_2P-P1.27-V-M-2
  round 1 hole 0.65: 1(-0.635,0) 2(0.635,0)
HDR-TH_2P-P3.96-V-M
  rect 2.6x2.6 hole 1.85: 1(-1.98,0)
  round 2.6 hole 1.85: 2(1.98,0)
HDR-TH_4P-P1.27-V-M
  rect 1x1 hole 0.6: 1(-1.905,0)
  round 1 hole 0.6: 2(-0.635,0) 3(0.635,0) 4(1.905,0)
HVSSOP-8_L3.0-W3.0-P0.65-LS4.9-BL-EP
  rect 0.364x1.43 smd: 1(-0.975,-2.065) 2(-0.325,-2.065) 3(0.325,-2.065) 4(0.975,-2.065) 5(0.975,2.065) 6(0.325,2.065) 7(-0.325,2.065) 8(-0.975,2.065)
  rect 1.8x1.5 smd: 9(0,0)
IND-SMD_L4.0-W4.0_SNR4030
  rect 1.5x4.4 smd: 1(-1.45,0) 2(1.45,0)
IND-SMD_L5.2-W5.2_YSPI0530
  rect 1.8x2.5 smd: 1(-2.4,0) 2(2.4,0)
IPEX-SMD_3P-L2.6-W2.6-LS3.0_RF1200001R
  rect 1x1.05 smd: 1(0,0.762)
  rect 1.05x2.2 smd: 2(-1.3,-0.762) 3(1.3,-0.762)
L0603
  rect 0.8x0.864 smd: 1(-0.7,0) 2(0.7,0)
L1210
  rect 1.2x2 smd: 1(-1.6,0) 2(1.6,0)
LQFP-100_L14.0-W14.0-P0.50-LS16.0-BL
  oval 0.3x1.6 smd: 1(-6,-7.55) 2(-5.5,-7.55) 3(-5,-7.55) 4(-4.5,-7.55) 5(-4,-7.55) 6(-3.5,-7.55) 7(-3,-7.55) 8(-2.5,-7.55) 9(-2,-7.55) 10(-1.5,-7.55) 11(-1,-7.55) 12(-0.5,-7.55) 13(0,-7.55) 14(0.5,-7.55) 15(1,-7.55) 16(1.5,-7.55) 17(2,-7.55) 18(2.5,-7.55) 19(3,-7.55) 20(3.5,-7.55) 21(4,-7.55) 22(4.5,-7.55) 23(5,-7.55) 24(5.5,-7.55) 25(6,-7.55) 51(6,7.55) 52(5.5,7.55) 53(5,7.55) 54(4.5,7.55) 55(4,7.55) 56(3.5,7.55) 57(3,7.55) 58(2.5,7.55) 59(2,7.55) 60(1.5,7.55) 61(1,7.55) 62(0.5,7.55) 63(0,7.55) 64(-0.5,7.55) 65(-1,7.55) 66(-1.5,7.55) 67(-2,7.55) 68(-2.5,7.55) 69(-3,7.55) 70(-3.5,7.55) 71(-4,7.55) 72(-4.5,7.55) 73(-5,7.55) 74(-5.5,7.55) 75(-6,7.55)
  oval 1.6x0.3 smd: 26(7.55,-6) 27(7.55,-5.5) 28(7.55,-5) 29(7.55,-4.5) 30(7.55,-4) 31(7.55,-3.5) 32(7.55,-3) 33(7.55,-2.5) 34(7.55,-2) 35(7.55,-1.5) 36(7.55,-1) 37(7.55,-0.5) 38(7.55,0) 39(7.55,0.5) 40(7.55,1) 41(7.55,1.5) 42(7.55,2) 43(7.55,2.5) 44(7.55,3) 45(7.55,3.5) 46(7.55,4) 47(7.55,4.5) 48(7.55,5) 49(7.55,5.5) 50(7.55,6) 76(-7.55,6) 77(-7.55,5.5) 78(-7.55,5) 79(-7.55,4.5) 80(-7.55,4) 81(-7.55,3.5) 82(-7.55,3) 83(-7.55,2.5) 84(-7.55,2) 85(-7.55,1.5) 86(-7.55,1) 87(-7.55,0.5) 88(-7.55,0) 89(-7.55,-0.5) 90(-7.55,-1) 91(-7.55,-1.5) 92(-7.55,-2) 93(-7.55,-2.5) 94(-7.55,-3) 95(-7.55,-3.5) 96(-7.55,-4) 97(-7.55,-4.5) 98(-7.55,-5) 99(-7.55,-5.5) 100(-7.55,-6)
MSOP-10_L3.0-W3.0-P0.50-LS5.0-BL
  oval 0.28x1.62 smd: 1(-1,-2.11) 2(-0.5,-2.11) 3(0,-2.11) 4(0.5,-2.11) 5(1,-2.11) 6(1,2.11) 7(0.5,2.11) 8(0,2.11) 9(-0.5,2.11) 10(-1,2.11)
OSC-SMD_4P-L2.5-W2.0-BL
  rect 1.2x1.1 smd: 1(-0.95,-0.75) 2(0.95,-0.75) 3(0.95,0.75) 4(-0.95,0.75)
OSC-SMD_4P-L2.5-W2.0-BL-3
  rect 1.2x1.1 smd: 1(-0.95,-0.75) 2(0.95,-0.75) 3(0.95,0.75) 4(-0.95,0.75)
QFN-16_L4.0-W4.0-P0.65-TL-EP2.2
  oval 1.087x0.364 smd: 1(-1.968,0.975) 2(-1.968,0.325) 3(-1.968,-0.325) 4(-1.968,-0.975) 9(1.968,-0.975) 10(1.968,-0.325) 11(1.968,0.325) 12(1.968,0.975)
  oval 0.364x1.087 smd: 5(-0.975,-1.968) 6(-0.325,-1.968) 7(0.325,-1.968) 8(0.975,-1.968) 13(0.975,1.968) 14(0.325,1.968) 15(-0.325,1.968) 16(-0.975,1.968)
  rect 2.16x2.16 smd: 17(0,0)
QFN-20_L4.0-W4.0-P0.50-BL-EP2.2
  rect 0.3x1 smd: 1(-1,-1.85) 2(-0.5,-1.85) 3(0,-1.85) 4(0.5,-1.85) 5(1,-1.85) 11(1,1.85) 12(0.5,1.85) 13(0,1.85) 14(-0.5,1.85) 15(-1,1.85)
  rect 1x0.3 smd: 6(1.85,-1) 7(1.85,-0.5) 8(1.85,0) 9(1.85,0.5) 10(1.85,1) 16(-1.85,1) 17(-1.85,0.5) 18(-1.85,0) 19(-1.85,-0.5) 20(-1.85,-1)
  rect 2.15x2.15 smd: 21(0,0)
QFN-28_L5.0-W5.0-P0.50-TL-EP3.2
  oval 0.95x0.28 smd: 1(-2.425,1.502) 2(-2.425,1.001) 3(-2.425,0.5) 4(-2.425,0) 5(-2.425,-0.5) 6(-2.425,-1) 7(-2.425,-1.501) 15(2.425,-1.501) 16(2.425,-1) 17(2.425,-0.5) 18(2.425,0) 19(2.425,0.5) 20(2.425,1.001) 21(2.425,1.502)
  oval 0.28x0.95 smd: 8(-1.502,-2.425) 9(-1.001,-2.425) 10(-0.5,-2.425) 11(0,-2.425) 12(0.5,-2.425) 13(1,-2.425) 14(1.501,-2.425) 22(1.501,2.425) 23(1,2.425) 24(0.5,2.425) 25(0,2.425) 26(-0.5,2.425) 27(-1.001,2.425) 28(-1.502,2.425)
  rect 3.15x3.15 smd: 29(0,0)
R0603
  rect 0.806x0.864 smd: 1(-0.753,0) 2(0.753,0)
SC-70-5_L2.1-W1.3-P0.65-LS2.1-BR
  rect 0.9x0.4 smd: 1(1.1,-0.65) 2(1.1,0) 3(1.1,0.65) 4(-1.1,0.65) 5(-1.1,-0.65)
SMA_L4.3-W2.6-LS5.1-BI
  rect 2x2 smd: 1(-2.2,0) 2(2.2,0)
SMA_L4.3-W2.6-LS5.1-RD
  rect 2x2 smd: 1(-2.2,0) 2(2.2,0)
SMD-4_L6.5-W4.6-P2.54-LS10.3-TL
  rect 2x1.5 smd: 1(-4.55,1.27) 2(-4.55,-1.27) 3(4.55,-1.27) 4(4.55,1.27)
SOIC-8_L5.0-W4.0-P1.27-LS6.0-BL
  oval 0.569x1.95 smd: 1(-1.905,-2.705) 2(-0.635,-2.705) 3(0.635,-2.705) 4(1.905,-2.705) 5(1.905,2.705) 6(0.635,2.705) 7(-0.635,2.705) 8(-1.905,2.705)
SOP-8_L5.3-W5.3-P1.27-LS7.9-BL
  oval 0.609x2.204 smd: 1(-1.905,-3.542) 2(-0.635,-3.542) 3(0.635,-3.542) 4(1.905,-3.542) 5(1.905,3.542) 6(0.635,3.542) 7(-0.635,3.542) 8(-1.905,3.542)
SOT-23-3_L2.9-W1.3-P1.90-LS2.4-BR
  rect 1x0.65 smd: 1(1,-0.95) 2(1,0.95) 3(-1,0)
SOT-23-3_L2.9-W1.5-P1.90-LS2.6-BR
  rect 1.25x0.7 smd: 1(1.25,-0.95) 2(1.25,0.95) 3(-1.25,0)
SOT-23-5_L3.0-W1.7-P0.95-LS2.8-BR
  rect 1.1x0.6 smd: 1(1.3,-0.95) 2(1.3,0) 3(1.3,0.95) 4(-1.3,0.95) 5(-1.3,-0.95)
SOT-23-6_L2.9-W1.6-P0.95-LS2.8-BL
  rect 0.532x1.072 smd: 1(-0.95,-1.149) 2(0,-1.149) 3(0.95,-1.149) 4(0.95,1.149) 5(0,1.149) 6(-0.95,1.149)
SOT-23_L2.9-W1.3-P1.90-LS2.4-BR
  rect 1x0.8 smd: 1(1.15,-0.95) 2(1.15,0.95) 3(-1.15,0)
SOT-223-3_L6.5-W3.4-P2.30-LS7.0-BR
  rect 2.5x1.1 smd: 1(2.97,-2.3) 2(2.97,0) 3(2.97,2.3)
  rect 2.34x3.6 smd: 4(-2.97,0)
SSOP-16_L4.9-W3.9-P0.64-LS6.0-BL
  oval 0.355x1.815 smd: 1(-2.223,-2.655) 2(-1.587,-2.655) 3(-0.953,-2.655) 4(-0.318,-2.655) 5(0.318,-2.655) 6(0.953,-2.655) 7(1.587,-2.655) 8(2.223,-2.655) 9(2.223,2.655) 10(1.587,2.655) 11(0.953,2.655) 12(0.318,2.655) 13(-0.318,2.655) 14(-0.953,2.655) 15(-1.587,2.655) 16(-2.223,2.655)
Test-Point-0.5mm
  round 0.5 smd: 1(0,0)
TSOT-26_L2.9-W1.6-P0.95-LS2.8-BL
  rect 0.55x1.1 smd: 1(-0.95,-1.2) 2(0,-1.2) 3(0.95,-1.2) 4(0.95,1.2) 5(0,1.2) 6(-0.95,1.2)
TSSOP-14_L5.0-W4.4-P0.65-LS6.5-BL
  rect 0.305x0.991 smd: 1(-1.95,-2.925) 2(-1.3,-2.925) 3(-0.65,-2.925) 4(0,-2.925) 5(0.65,-2.925) 6(1.3,-2.925) 7(1.95,-2.925) 8(1.95,2.925) 9(1.3,2.925) 10(0.65,2.925) 11(0,2.925) 12(-0.65,2.925) 13(-1.3,2.925) 14(-1.95,2.925)
TSSOP-16_L5.0-W4.4-P0.65-LS6.4-BL
  oval 0.343x1.732 smd: 1(-2.275,-2.866) 2(-1.625,-2.866) 3(-0.975,-2.866) 4(-0.325,-2.866) 5(0.325,-2.866) 6(0.975,-2.866) 7(1.625,-2.866) 8(2.275,-2.866) 9(2.275,2.866) 10(1.625,2.866) 11(0.975,2.866) 12(0.325,2.866) 13(-0.325,2.866) 14(-0.975,2.866) 15(-1.625,2.866) 16(-2.275,2.866)
USB-C-SMD_TYPE-C16PIN
  oval 1x2.1 hole 0.6x1.7: 1(-4.32,1.788) 2(4.32,1.788)
  oval 1x1.8 hole 0.6x1.4: 3(-4.32,-2.362) 4(4.32,-2.362)
  rect 0.6x1.15 smd: A1B12(-3.2,2.362) A4B9(-2.4,2.362) B1A12(3.2,2.362) B4A9(2.4,2.362)
  rect 0.3x1.15 smd: A5(-1.25,2.362) A6(-0.25,2.362) A7(0.25,2.362) A8(1.25,2.362) B5(1.75,2.362) B6(0.75,2.362) B7(-0.75,2.362) B8(-1.75,2.362)
XFMR-SMD_TC1-1TX
  rect 0.8x1.65 smd: 1(-1.27,1.59) 2(0,1.59) 3(1.27,1.59) 4(1.27,-1.59) 6(-1.27,-1.59)

## Nets
As in the schematic.

Pads without a net: EXT_PA 3 4 7; FPC1 5 6; HAND_MIC 4; KEY 3 4 7; PHONE 4 7; U1 13 17 18 69; U5 2 6; U9 3 9; U12 4 5 10 13; U13 8 9; U18 1 5 6 12 15; U20 2; U25 9 15; U26 7; U31 3 5 7 9 13 15 16 17 18; U37 4; U39 4; USB1 A8 B8

## Via types
v1: diameter 0.6, hole 0.3, Top Layer to Bottom Layer, 14 vias

## Routing (per net, layer and track width the routed paths; a pad name or vN(x,y) marks a point on that pad's centre or on a via; arc(x,y) is an arc through that point)
3V3_LO: length 1.5
  Top Layer w0.2: L5.2 L6.2
8V_RF: length 10.8
  Top Layer w0.2: C91.2 C89.2 141.99,17.24 U18.14 ; Q4.3 R69.1 ; 127.79,25.36 131.19,25.36
AVDD_CODEC: length 6.3
  Top Layer w0.2: U5.18 42.46,36.26 C30.2 C32.2 L4.2
VBATT: length 2.4
  Bottom Layer w0.2: 41.7,-18.88 41.7,-21.27
VDDA: length 6.9
  Top Layer w0.2: 52.7,67.03 U1.21 53.2,63.98 C5.2 54.89,63.97 C4.2 56.56,63.99
5351_CLK2: length 10.1
  Top Layer w0.2: 56.75,71.08 65.77,71.08 R35.1
CODEC_ADCDAT: length 6.9
  Top Layer w0.2: U1.2 43.7,60.62 v1(43.37,60.29)
CODEC_DACLRC: length 1.1
  Top Layer w0.2: v1(38.92,40.38) 38.95,40.35 40.03,40.35
CODEC_MCLK: length 0.3
  Top Layer w0.2: 42.44,61.5 R1.1
CTL_SDO: length 1.7
  Top Layer w0.2: 144.5,36.3 R104.1
I2C1_SCL: length 8.2
  Top Layer w0.2: v1(43.93,72.67) 43.84,72.58 U1.92 ; R30.2 75.02,72.27 76.13,71.16 76.13,68.77 75.93,68.56 U9.4
I2C1_SDA: length 4.2
  Top Layer w0.2: U9.5 74.39,69.54 R29.2 ; 41.65,72.08 43.75,72.08 v1(43.91,71.91)
I_IN: length 9
  Top Layer w0.2: C51.2 57.69,44.76 R46.2 57.72,44.66 U10.7 57.72,40.97 57.16,40.41 C16.1
I_OUT: length 5.1
  Top Layer w0.2: C22.1 39.36,24.05 40.45,22.96 R61.1
L_OUT: length 4.8
  Top Layer w0.2: C23.1 28.7,35.67 R20.2 28.67,35.64 C35.2
MCU_VDD: length 2.9
  Top Layer w0.2: C7.2 58.06,69.08 56.75,69.08
MIC_IN: length 1.7
  Top Layer w0.2: R18.2 50.46,38.43 C17.1
Q_IN: length 7.3
  Top Layer w0.2: C18.1 56.07,38.66 56.45,38.28 U10.1 56.45,35.05 R36.2 56.3,33.25 56.35,33.19
R_CLK_S0: length 18.5
  Top Layer w0.2: U12.14 72.34,40.04 74.02,41.72 74.02,46.79 79.98,52.75 R33.1
R_CLK_S1: length 18.2
  Top Layer w0.2: R31.2 72.13,51.97 63.81,43.66 63.81,41.45 64.57,40.69 65.5,40.69
SPK_SD: length 4.8
  Top Layer w0.2: R24.2 18.55,24.48 PHONE.2
SPK_VCC: length 3.4
  Top Layer w0.2: C33.2 C34.2 19.52,37.22 R25.2
T/R_SW: length 7.7
  Top Layer w0.2: 65.5,41.34 69.6,41.34 70.25,40.69 U12.15 ; C53.2 65.5,41.34
TX_BIAS: length 9
  Top Layer w0.2: U13.12 48.97,11.27 C62.2 50.24,11.43 U13.14 ; R138.1 171.41,-0.05
$2N1: length 5.4
  Top Layer w0.2: 55.25,57.26 53.45,57.26 C1.2 51.4,57.27 U3.1 U3.4
$2N3: length 2
  Bottom Layer w0.2: C3.2 47.77,62.2 U2.1
$2N4: length 2
  Bottom Layer w0.2: U2.2 46,62.18 C2.2
$2N128: length 3.8
  Top Layer w0.2: 48.7,67.03 48.7,63.23
$2N129: length 4
  Top Layer w0.2: R1.2 42.65,63.84 43.2,64.38 U1.1
$2N134: length 7.5
  Top Layer w0.2: R2.2 44.47,60.72 44.2,60.99 U1.3
$2N138: length 8.4
  Top Layer w0.2: R4.2 47.52,60.12 45.2,62.44 U1.5
$2N139: length 8
  Top Layer w0.2: U1.4 44.7,61.56 45.99,60.27 R3.2
$2N149: length 3.1
  Top Layer w0.2: U3.3 49.86,59.17 48.7,60.33 R6.1
$3N1: length 4.3
  Top Layer w0.2: U5.10 37.98,40.85 37.19,41.63 R19.2
$3N34: length 2.6
  Top Layer w0.2: C17.2 46.94,38.85 U5.22
$3N37: length 1.8
  Top Layer w0.2: C27.2 C21.2
$3N38: length 1.8
  Top Layer w0.2: C28.2 C22.2
$3N39: length 10.2
  Top Layer w0.2: C19.2 C16.2 52.5,39.85 U5.24
$3N40: length 10.2
  Top Layer w0.2: C20.2 C18.2 52.37,39.35 U5.23
$3N52: length 4
  Top Layer w0.2: 21.97,32.47 21.96,32.48 Q2.3 19.51,33.97 R25.1
$3N57: length 1.7
  Top Layer w0.2: 25.38,35.64 R27.1
$3N63: length 7.2
  Top Layer w0.2: C25.1 C26.1 46.67,35.39 45.31,36.76 44.05,36.76 43.46,37.35 U5.20
$3N71: length 3.8
  Top Layer w0.2: R17.1 46.81,36.82 45.7,37.92 U5.21
$3N72: length 1.7
  Top Layer w0.2: R17.2 50.37,36.82 R18.1
$3N75: length 1.5
  Top Layer w0.2: Q2.1 18.56,28.95 R24.1
$3N81: length 1.5
  Top Layer w0.2: U6.4 25.38,32.47 R27.2
$3N82: length 1.7
  Top Layer w0.2: C36.2 23.63,28.41 R26.1
$3N83: length 2.6
  Top Layer w0.2: R26.2 23.27,30.5 U6.3
$3N84: length 2.6
  Top Layer w0.2: C37.2 22.62,30.53 U6.2
$4N1: length 2
  Top Layer w0.2: C42.2 74.87,67.56 U9.2
$4N2: length 2
  Top Layer w0.2: U8.3 80.22,67.56 C42.1 ; 80.33,67.56 80.33,67.57
$4N3: length 5.9
  Top Layer w0.2: C38.2 83.9,65.66 U8.1 U8.4 L5.1
$4N7: length 14.6
  Top Layer w0.2: 72.9,72.27 72.89,72.26 R29.1 72.89,68.46 72.3,67.87 ; 76.53,65.66 C40.2 74.87,65.73 U9.1 73.07,67.06 71.57,68.56 U9.7 C39.2
$4N20: length 3.1
  Top Layer w0.2: R35.2 68.51,70.31 69.77,69.06 U9.6
$4N21: length 3.5
  Top Layer w0.2: R28.1 70.65,66.47 TP1.1 70.65,66.47 U9.10
$4N22: length 10
  Top Layer w0.2: R28.2 70.65,61.07 71.57,60.15 U7.3 75.67,60.15 76.32,59.5 79.08,59.5
$4N25: length 10.3
  Top Layer w0.2: 79.08,60.15 77.02,60.15 v1(77.02,60.16) ; R31.1 72.13,58.28 72.7,58.85 U7.5 v1(74.73,58.85)
  Bottom Layer w0.2: v1(74.73,58.85) 75.02,58.85 76.32,60.16 v1(77.02,60.16)
$4N26: length 3.7
  Top Layer w0.2: R32.1 74.72,57.73 74.25,58.2 U7.6
$4N27: length 17.9
  Top Layer w0.2: U7.4 75.64,59.5 76.3,58.85 79.08,58.85 79.08,58.85 79.75,58.85 79.95,59.05 79.95,60.58 79.75,60.78 79.11,60.78 79.08,60.8 79.08,61.45 ; 79.08,61.45 80.92,61.45 ; 79.08,61.45 U7.1
$4N28: length 12
  Top Layer w0.2: R34.2 76.39,57.13 76.8,57.54 v1(78.03,57.54) 79.07,57.54 79.08,57.55 ; U7.2 v1(75.21,60.8)
  Bottom Layer w0.2: v1(75.21,60.8) 75.21,60.81 77.36,60.81 78.03,60.13 v1(78.03,57.54)
$4N29: length 3.2
  Top Layer w0.2: 79.08,58.2 79.69,58.2 79.98,57.92 R33.2
$5N9: length 1.7
  Top Layer w0.2: U11.4 Q3.3
$5N10: length 4.7
  Top Layer w0.2: C48.2 R45.2 Q3.1 R40.1
$5N12: length 5.7
  Top Layer w0.2: 82.67,37.09 C47.1 R37.1 ; U11.6 R40.2
$5N13: length 6.3
  Top Layer w0.2: U11.2 78.15,38.36 78.77,37.75 C52.2 ; R49.1 78.77,35.19
$5N14: length 2.9
  Top Layer w0.2: R48.2 R47.2 Q3.2
$5N15: length 1.6
  Top Layer w0.2: C54.2 82.67,43.51
$5N22: length 4.2
  Top Layer w0.2: U10.8 56.45,44.3 C43.2 56.03,44.72 L9.1
$5N29: length 8.7
  Top Layer w0.2: 65.5,40.04 66.53,40.04 67.84,38.74 U12.12 72.99,38.74 R41.2
$5N30: length 12.7
  Top Layer w0.2: U12.9 67.76,36.79 65.87,34.9 R38.1 61.02,33.19 C46.2
$5N31: length 12.7
  Top Layer w0.2: 65.5,37.44 62.45,37.44 61.36,38.52 61.36,43.5 60.77,44.1 R42.1 ; C49.2 60.77,44.81
$5N37: length 5.7
  Top Layer w0.2: U10.2 57.8,37.04 R36.1 ; R36.1 57.8,33.25 C45.1 ; R36.1 59.51,34.89
$5N44: length 1.7
  Top Layer w0.2: 71.23,43.02 71.23,41.34
$5N71: length 8
  Top Layer w0.2: U10.5 60.26,40.5 58.99,39.23 U10.3
  Bottom Layer w0.2: C50.2 60.07,41.02 R43.1 59.78,39.16
$5N75: length 5.6
  Top Layer w0.2: 59.15,46.32 59.16,46.31 R46.1 58.99,44.55 U10.6 ; 59.15,46.32 C51.1 ; 59.15,46.32 R42.2
$5N81: length 8.1
  Top Layer w0.2: R39.2 72.98,38.09 U12.11 65.5,38.09
$5N82: length 2.3
  Top Layer w0.2: R39.1 75.48,37.09 U11.1
$5N83: length 2.2
  Top Layer w0.2: R41.1 75.39,39.63 U11.3
$6N1: length 14.2
  Top Layer w0.2: C77.2 74.47,18.54 72.93,17 69.82,17 v1(69.7,16.88) ; R55.2 63.41,14.43 64.68,15.7 U14.6 69.21,15.7 v1(69.33,15.82)
  Bottom Layer w0.2: v1(69.33,15.82) 69.33,16.51 v1(69.7,16.88)
$6N2: length 12.4
  Top Layer w0.2: C76.2 73.88,16.81 73.42,16.35 U14.5 64.34,16.35 63.95,15.96 R62.2
$6N3: length 14.4
  Top Layer w0.2: C75.2 73.96,15.09 73.34,15.7 69.96,15.7 69.43,15.17 v1(68.11,15.17) ; v1(67.75,17) 67.75,17 U14.4 64.36,17 63.87,17.49 R65.2
  Bottom Layer w0.2: v1(68.11,15.17) 68.11,16.64 v1(67.75,17)
$6N4: length 15.5
  Top Layer w0.2: v1(69.7,14.7) 70.05,15.05 72.84,15.05 74.51,13.37 C74.2 ; v1(68.81,16.88) 68.05,17.65 U14.3 64.74,17.65 63.37,19.01 R60.2
  Bottom Layer w0.2: v1(68.81,16.88) 68.81,16.05 68.81,16.04 68.81,15.6 v1(69.7,14.7)
$6N5: length 2
  Top Layer w0.2: U15.1 R64.2
$6N6: length 2
  Top Layer w0.2: R57.2 U15.3
$6N8: length 14.9
  Top Layer w0.2: C68.1 48.09,15.77 47.7,15.37 U13.10 47.7,12.43 R63.1 47.14,11.88 C70.1
$6N10: length 7.4
  Top Layer w0.2: R61.2 45.67,22.96 C69.1 47.22,22.96 R66.1 48.33,22.05 U13.6
$6N11: length 8.4
  Top Layer w0.2: 53.44,21.65 R59.2 51.51,21.32 U13.1 ; C66.1 55.27,21.7 C63.2
$6N12: length 5.7
  Top Layer w0.2: C63.1 53.44,23.16 R59.1 50.87,22.19 U13.2
$6N13: length 5.6
  Top Layer w0.2: C65.1 51.81,10.66 R56.1 50.87,11.49 U13.15
$6N14: length 8.3
  Top Layer w0.2: C64.1 55.48,12.06 C65.2 53.3,12.11 R56.2 51.51,12.36 U13.16
$6N15: length 2.5
  Top Layer w0.2: R55.1 60.66,13.75 C64.2
$6N16: length 2.5
  Top Layer w0.2: R60.1 60.55,19.8 C66.2
$6N17: length 2.2
  Top Layer w0.2: C68.2 61.15,15.77 R62.1
$6N18: length 2.3
  Top Layer w0.2: R65.1 61.04,17.78 C71.2
$6N24: length 3.3
  Top Layer w0.2: R64.1 67.69,14.42 67.06,15.05 U14.7
$6N25: length 2.7
  Top Layer w0.2: 71.78,14.4 70.67,14.4 70.23,13.95 R57.1
$6N32: length 18.8
  Top Layer w0.2: R67.1 44.11,19.99 C69.2 47.31,21.56 R66.2 47.7,21.17 U13.7 47.7,18.24 48.15,17.78 C71.1
$6N36: length 12.6
  Top Layer w0.2: R133.2 67.15,23.5 ; 71.78,18.3 70.8,18.3 70.15,18.95 U14.1 66.05,21.08 Q8.3 67.15,22.19 C186.2
$6N42: length 4.9
  Top Layer w0.2: L12.1 C59.2 71.78,20.38 C58.2 71.78,18.95
$6N43: length 5
  Top Layer w0.2: C72.2 68.34,7.57 68.96,8.19 U15.2
$6N54: length 2.6
  Top Layer w0.2: C73.2 49.6,19.49
$6N76: length 2.1
  Top Layer w0.2: U15.4 72.27,6.33 C67.1
$6N77: length 3.3
  Top Layer w0.2: C67.2 75.44,6.31 R134.1 R135.2
$6N78: length 3.3
  Top Layer w0.2: 76.95,7.83 R134.2 78.76,6.31 C78.2
$6N83: length 12.7
  Top Layer w0.2: R67.2 44.11,11.98 C70.2 45.65,10.43 R63.2 48.33,11.56 U13.11
$6N86: length 3.2
  Top Layer w0.2: C176.2 R140.1 R137.2
$6N91: length 3.1
  Top Layer w0.2: 169.87,-1.55 168.37,-1.55 166.73,-1.55
$6N93: length 3.3
  Top Layer w0.2: 166.73,1.58 168.37,1.58 168.37,-0.04
$6N94: length 3.3
  Top Layer w0.2: C178.2 R141.1 R140.2
$7N1: length 5.5
  Top Layer w0.2: U19.1 134.01,18.84 R76.2 134.46,19.54 R70.1
$7N2: length 5.6
  Top Layer w0.2: U19.3 133.89,16.3 R76.1 134.46,15.59 R79.1
$7N3: length 1.8
  Top Layer w0.2: R79.2 138.03,14.43 138.03,15.6
$7N4: length 1.8
  Top Layer w0.2: 138.03,19.53 138.03,20.72 R70.2
$7N5: length 1.8
  Top Layer w0.2: R78.1 138.68,14.39 U18.11
$7N6: length 1.6
  Top Layer w0.2: C86.2 142.05,22.68 R73.1
$7N7: length 3.3
  Top Layer w0.2: R73.2 139.08,22.68 R77.1 138.68,20.76 138.68,19.53
$7N8: length 4.2
  Top Layer w0.2: R71.1 140.59,21.16 140.32,20.89 U18.16
$7N9: length 4.2
  Top Layer w0.2: U18.13 140.32,14.25 R78.2 R80.1
$7N10: length 4
  Top Layer w0.2: R71.2 144.95,21.16 C85.1 C83.1
$7N11: length 4
  Top Layer w0.2: C88.1 C87.1 145.1,13.99 R80.2
$7N12: length 3.5
  Top Layer w0.2: C87.2 C88.2 147.08,16.25 U20.4
$7N13: length 3.6
  Top Layer w0.2: C85.2 C83.2 148.92,18.79 U20.6
$7N15: length 1.7
  Top Layer w0.2: R82.2 R81.1
$7N17: length 3.1
  Top Layer w0.2: R84.2 142.64,30.15 Q5.1 ; R83.2 142.64,28.8
$7N30: length 1.9
  Top Layer w0.2: U19.6 127.55,18.84
$7N32: length 4.2
  Top Layer w0.2: R72.2 126.15,18.84 R75.2
$7N33: length 1.6
  Top Layer w0.2: R72.1 R74.2
$7N38: length 8.9
  Top Layer w0.2: U19.2 131.88,17.57 131.19,18.26 R68.1 131.19,20.45 C82.2 131.19,22.09 R69.2 131.2,23.85 C81.2
$7N41: length 2.9
  Top Layer w0.2: L16.1 Q4.2 R81.2
$7N44: length 1.5
  Top Layer w0.2: Q5.3 R82.1
$9N4: length 4.6
  Top Layer w0.2: C103.2 C108.2 183.33,-21.31 L19.1
$9N5: length 7.4
  Top Layer w0.2: C102.1 174.94,-18.11 L21.2 177.98,-18.11 C107.1 C103.1
$9N6: length 4.8
  Top Layer w0.2: C102.2 C106.2 171.29,-21.31 L18.2
$9N10: length 4.6
  Top Layer w0.2: L25.1 183.33,-28.04 C118.2 C113.2
$9N11: length 7.4
  Top Layer w0.2: C112.1 174.94,-24.84 L28.2 177.98,-24.84 C117.1 C113.1
$9N12: length 4.8
  Top Layer w0.2: L24.2 171.29,-28.04 C116.2 C112.2
$9N16: length 4.6
  Top Layer w0.2: C123.2 C128.2 183.33,-34.77 L31.1
$9N17: length 7.4
  Top Layer w0.2: C122.1 174.94,-31.57 L33.2 177.98,-31.57 C127.1 C123.1
$9N18: length 4.8
  Top Layer w0.2: C122.2 C126.2 171.29,-34.77 L30.2
$9N22: length 4.6
  Top Layer w0.2: C133.2 C136.2 183.33,-41.38 L37.1
$9N23: length 7.4
  Top Layer w0.2: C133.1 C135.1 177.98,-38.18 L38.2 174.94,-38.18 C132.1
$9N24: length 4.8
  Top Layer w0.2: C132.2 C134.2 171.29,-41.38 L36.2
$9N34: length 4.6
  Top Layer w0.2: L23.1 183.33,-48.11 C111.2 C105.2
$9N35: length 4.6
  Top Layer w0.2: C125.2 C131.2 183.33,-61.19 L35.1
$9N36: length 4.6
  Top Layer w0.2: C115.2 C121.2 183.33,-54.46 L27.1
$9N37: length 7.4
  Top Layer w0.2: C124.1 174.94,-57.99 L34.2 177.98,-57.99 C130.1 C125.1
$9N38: length 7.4
  Top Layer w0.2: C104.1 174.94,-44.91 L22.2 177.98,-44.91 C110.1 C105.1
$9N39: length 7.4
  Top Layer w0.2: C115.1 C120.1 177.98,-51.26 L29.2 174.94,-51.26 C114.1
$9N40: length 4.8
  Top Layer w0.2: C104.2 C109.2 171.29,-48.11 L20.2
$9N41: length 4.8
  Top Layer w0.2: C124.2 C129.2 171.29,-61.19 L32.2
$9N42: length 4.8
  Top Layer w0.2: C114.2 C119.2 171.29,-54.46 L26.2
$11N18: length 6
  Top Layer w0.2: 140.5,33.75 146.48,33.75 C138.2
$11N26: length 12
  Top Layer w0.2: U27.9 138.15,37.85 C142.2 ; C142.2 139.66,37.98 ; C142.2 136.42,37.98 135.7,37.27 135.7,34.67 136.12,34.25 U27.13 ; U27.6 139.65,37.98
$11N28: length 2.8
  Top Layer w0.2: 134.04,33.75 136.8,33.75 U27.14
$11N32: length 2.6
  Top Layer w0.2: R104.2 142.68,34.25 140.5,34.25
$13N5: length 7.9
  Bottom Layer w0.2: U31.8 43.9,-19.91 44.81,-19 44.81,-13.79
$13N10: length 4.4
  Bottom Layer w0.2: GPS1.1 43.89,-32.98 L40.2 ; U31.11 43.9,-32.97
$13N15: length 5.8
  Bottom Layer w0.2: C155.2 40.58,-32.97 C154.2 ; C154.2 40.6,-32.96 U31.14 ; C154.2 40.58,-32.97 L40.1
$13N16: length 2
  Bottom Layer w0.2: R119.2 37.29,-21.27
$13N17: length 2
  Bottom Layer w0.2: R120.2 39.49,-21.27 39.49,-21.27

## Copper pours and planes (outline as drawn; the poured copper is in the pictures)
$14N11 on Top Layer: 118.22,85.52 126.96,85.52 126.96,83.05 118.22,83.05
